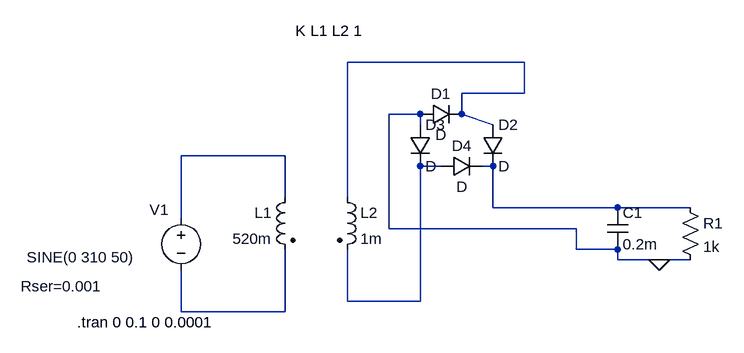
[diagram p0: schematic Draft1.asc]
Draft1.asc, the LTspice schematic file:
Version 4
SHEET 1 880 680
WIRE 272 -112 0 -112
WIRE 272 -64 272 -112
WIRE 272 -64 176 -64
WIRE 112 -32 64 -32
WIRE 176 -32 176 -64
WIRE 112 -16 112 -32
WIRE 224 -16 176 -32
WIRE -96 32 -256 32
WIRE 144 48 112 48
WIRE 224 48 208 48
WIRE -96 96 -96 32
WIRE 0 96 0 -112
WIRE 224 112 224 48
WIRE 416 112 224 112
WIRE 528 112 416 112
WIRE -256 128 -256 32
WIRE 64 144 64 -32
WIRE 352 144 64 144
WIRE 352 176 352 144
WIRE 416 176 352 176
WIRE 416 192 416 176
WIRE 480 192 416 192
WIRE 528 192 480 192
WIRE 0 256 0 176
WIRE 112 256 112 48
WIRE 112 256 0 256
WIRE -256 272 -256 208
WIRE -96 272 -96 176
WIRE -96 272 -256 272
FLAG 480 192 0
SYMBOL ind2 -80 80 M0
SYMATTR InstName L1
SYMATTR Value 520m
SYMATTR Type ind
SYMBOL ind2 -16 80 R0
SYMATTR InstName L2
SYMATTR Value 1m
SYMATTR Type ind
SYMBOL diode 112 -16 R270
WINDOW 0 32 32 VTop 2
WINDOW 3 0 32 VBottom 2
SYMATTR InstName D1
SYMBOL diode 208 -16 R0
SYMATTR InstName D2
SYMBOL cap 400 112 R0
SYMATTR InstName C1
SYMATTR Value 0.2m
SYMBOL res 512 96 R0
SYMATTR InstName R1
SYMATTR Value 1k
SYMBOL voltage -256 112 R0
WINDOW 0 -49 3 Left 2
WINDOW 3 -238 76 Left 2
WINDOW 123 0 0 Left 0
WINDOW 39 -247 121 Left 2
SYMATTR InstName V1
SYMATTR Value SINE(0 310 50)
SYMATTR SpiceLine Rser=0.001
SYMBOL diode 96 -16 R0
SYMATTR InstName D3
SYMBOL diode 144 64 R270
WINDOW 0 32 32 VTop 2
WINDOW 3 0 32 VBottom 2
SYMATTR InstName D4
TEXT -416 288 Left 2 !.tran 0 0.1 0 0.0001
TEXT -80 -160 Left 2 !K L1 L2 1

The netlist it stands for:
* Draft1.asc
L1 N002 N005 520m
L2 N001 N003 1m
D1 0 N001 D
D2 N001 N004 D
C1 N004 0 0.2m
R1 N004 0 1k
V1 N002 N005 SINE(0 310 50) Rser=0.001
D3 0 N003 D
D4 N003 N004 D
.model D D
.lib standard.dio
.tran 0 0.1 0 0.0001
K L1 L2 1
.backanno
.end